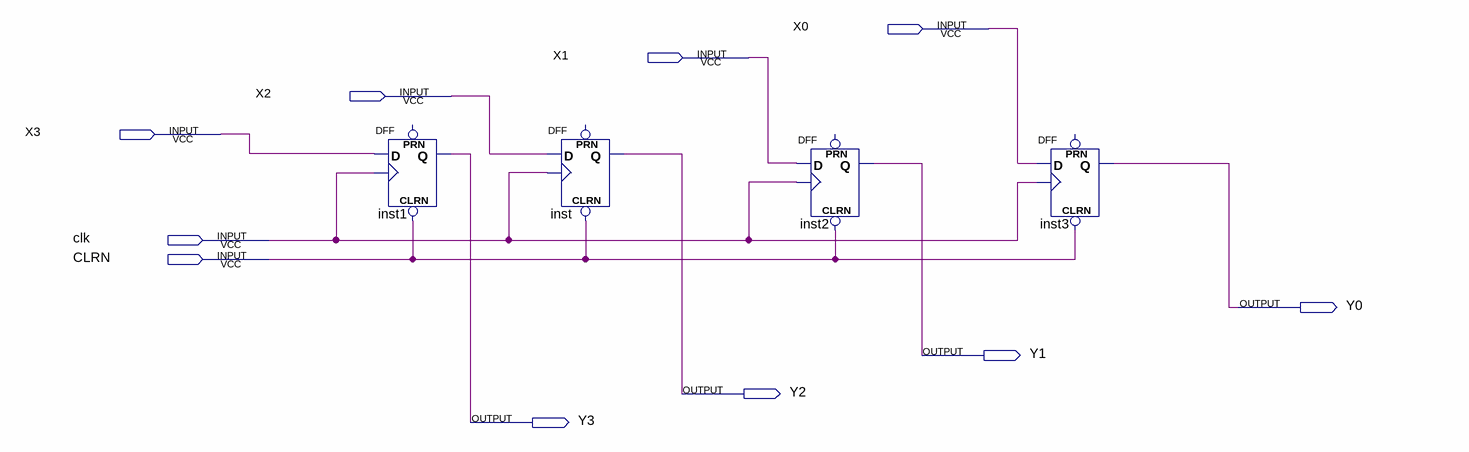
[diagram p0: schematic sheet]
// Quartus schematic register4bit.bdf as structural Verilog: 4 symbols, 10 pins
module register4bit (
  input  X0,
  input  X1,
  input  X2,
  input  X3,
  input  clk,
  input  CLRN,
  output Y0,
  output Y1,
  output Y2,
  output Y3
);

  DFF inst1 (.CLRN(CLRN), .CLK(clk), .D(X3), .Q(Y3));  // open: PRN
  DFF inst (.CLRN(CLRN), .CLK(clk), .D(X2), .Q(Y2));  // open: PRN
  DFF inst2 (.CLRN(CLRN), .CLK(clk), .D(X1), .Q(Y1));  // open: PRN
  DFF inst3 (.CLRN(CLRN), .CLK(clk), .D(X0), .Q(Y0));  // open: PRN
endmodule
